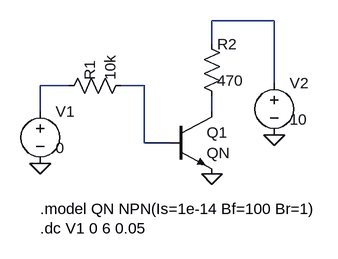
[diagram p0: schematic Ex07.asc]
Ex07.asc, the LTspice schematic file:
Version 4
SHEET 1 880 680
WIRE 60 200 60 160
WIRE 60 160 104 160
WIRE 184 160 220 160
WIRE 220 160 220 248
WIRE 220 248 260 248
WIRE 324 200 324 176
WIRE 324 96 324 60
WIRE 324 60 420 60
WIRE 420 60 420 156
FLAG 60 280 0
FLAG 324 296 0
FLAG 420 236 0
SYMBOL voltage 60 184 R0
WINDOW 0 24 16 Left 2
WINDOW 3 24 72 Left 2
SYMATTR InstName V1
SYMATTR Value 0
SYMBOL res 88 176 R270
WINDOW 0 24 48 Left 2
WINDOW 3 24 80 Left 2
SYMATTR InstName R1
SYMATTR Value 10k
SYMBOL npn 260 200 R0
WINDOW 0 56 32 Left 2
WINDOW 3 56 64 Left 2
SYMATTR InstName Q1
SYMATTR Value QN
SYMBOL res 308 80 R0
WINDOW 0 24 16 Left 2
WINDOW 3 24 72 Left 2
SYMATTR InstName R2
SYMATTR Value 470
SYMBOL voltage 420 140 R0
WINDOW 0 24 16 Left 2
WINDOW 3 24 72 Left 2
SYMATTR InstName V2
SYMATTR Value 10
TEXT 60 350 Left 2 !.model QN NPN(Is=1e-14 Bf=100 Br=1)
TEXT 60 380 Left 2 !.dc V1 0 6 0.05

The netlist it stands for:
* Ex07.asc
V1 N001 0 0
R1 N001 N002 10k
Q1 N003 N002 0 0 QN
R2 N004 N003 470
V2 N004 0 10
.model NPN NPN
.model PNP PNP
.lib standard.bjt
.model QN NPN(Is=1e-14 Bf=100 Br=1)
.dc V1 0 6 0.05
.backanno
.end